# EAGLE design Fernsteuerung (EAGLE 7.7.0)
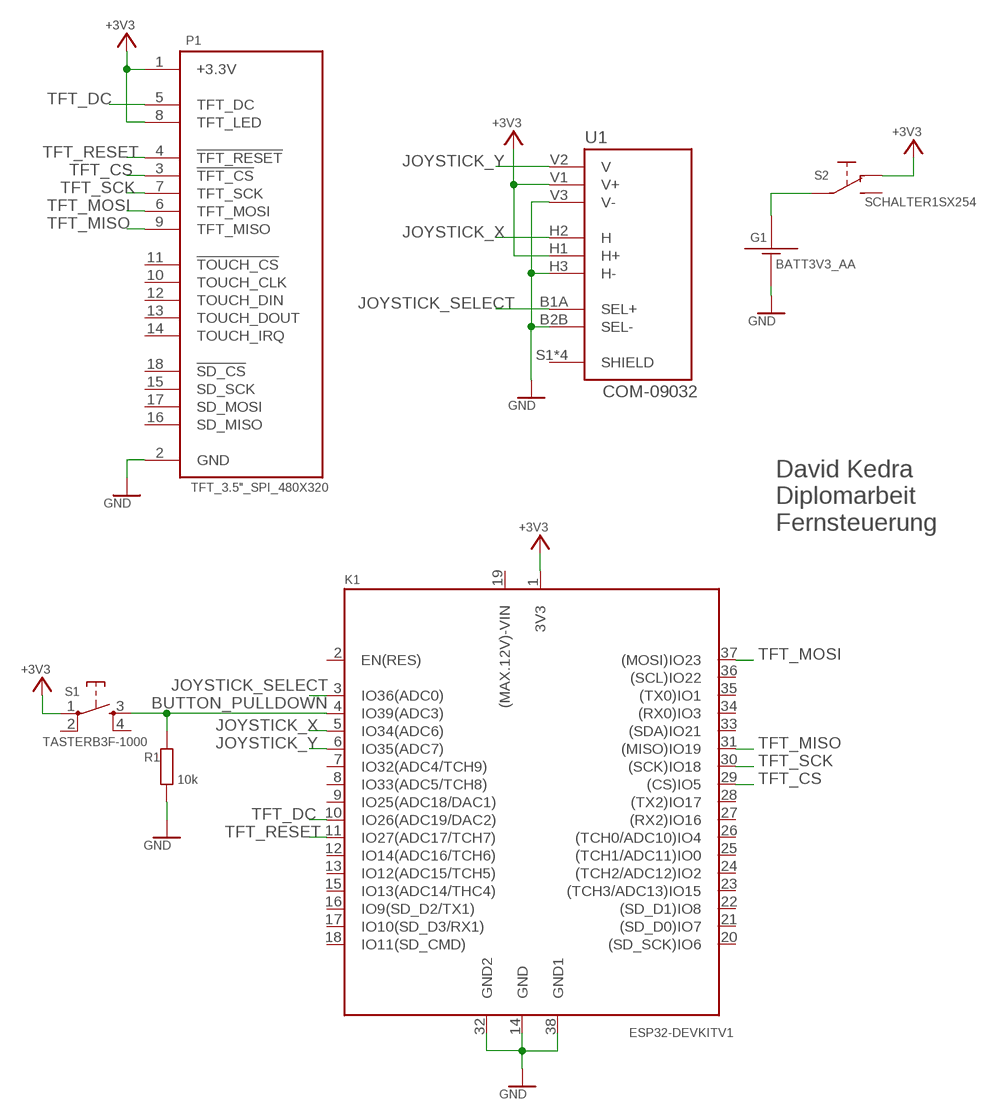
[diagram p0: schematic, sheet 1]

## Parts
G1  BATT3V3_AA  [BATT-3V3-AA]
K1  ESP32DEVKITV11000MIL  [ESP32-DEVKITV1]
P1  TFT_3.5"_SPI_480X320  [TFT_3.5"_SPI_480X320]
R1  10k  R1206  [R1206]
S1  TASTERB3F-1000  [B3F-10XX]
S2  SCHALTER1SX254  [SX254]
U1  COM-09032  [XDCR_COM-09032]

## Nets
+3V3: K1.1(3V3) P1.1(+3.3V) P1.8(TFT_LED) S1.1(P) S2.O1 U1.H1(H+) U1.V1(V+)
BATTERY_+3V3: G1.PLUS S2.W1
BUTTON_PULLDOWN: K1.4(IO39(ADC3)) R1.2 S1.3(S)
GND: G1.MINUS K1.14(GND) K1.32(GND2) K1.38(GND1) P1.2(GND) R1.1 U1.B2B(SEL-) U1.H3(H-) U1.V3(V-)
JOYSTICK_SELECT: K1.3(IO36(ADC0)) U1.B1A(SEL+)
JOYSTICK_X: K1.5(IO34(ADC6)) U1.H2(H)
JOYSTICK_Y: K1.6(IO35(ADC7)) U1.V2(V)
TFT_CS: K1.29((CS)IO5) P1.3(!TFT_CS!)
TFT_DC: K1.10(IO26(ADC19/DAC2)) P1.5(TFT_DC)
TFT_MISO: K1.31((MISO)IO19) P1.9(TFT_MISO)
TFT_MOSI: K1.37((MOSI)IO23) P1.6(TFT_MOSI)
TFT_RESET: K1.11(IO27(ADC17/TCH7)) P1.4(!TFT_RESET!)
TFT_SCK: K1.30((SCK)IO18) P1.7(TFT_SCK)
Unconnected: K1.2(EN(RES)) K1.7(IO32(ADC4/TCH9)) K1.8(IO33(ADC5/TCH8)) K1.9(IO25(ADC18/DAC1)) K1.12(IO14(ADC16/TCH6)) K1.13(IO12(ADC15/TCH5)) K1.15(IO13(ADC14/THC4)) K1.16(IO9(SD_D2/TX1)) K1.17(IO10(SD_D3/RX1)) K1.18(IO11(SD_CMD)) K1.19((MAX.12V)-VIN) K1.20((SD_SCK)IO6) K1.21((SD_D0)IO7) K1.22((SD_D1)IO8) K1.23((TCH3/ADC13)IO15) K1.24((TCH2/ADC12)IO2) K1.25((TCH1/ADC11)IO0) K1.26((TCH0/ADC10)IO4) K1.27((RX2)IO16) K1.28((TX2)IO17) K1.33((SDA)IO21) K1.34((RX0)IO3) K1.35((TX0)IO1) K1.36((SCL)IO22) P1.10(TOUCH_CLK) P1.11(!TOUCH_CS!) P1.12(TOUCH_DIN) P1.13(TOUCH_DOUT) P1.14(TOUCH_IRQ) P1.15(SD_SCK) P1.16(SD_MISO) P1.17(SD_MOSI) P1.18(!SD_CS!) S1.2(P1) S1.4(S1) S2.S1 U1.S1(SHIELD) U1.S2(SHIELD) U1.S3(SHIELD) U1.S4(SHIELD)

## Notes on the sheet
- David Kedra
  Diplomarbeit
  Fernsteuerung

## Library data of the parts
G1 = HTL22_basis:BATT: Batterieanschluss Folgende Batteriegrößen sind enthalten: 9V-Batterieclip Drahtanschluss 9V-Batterieclip Drahtanschluss Reverse 9V-Batteriehalter Keystone Datum: 26.03.2019 erstellt von: neca@htl-donaustadt.at
K1 = HTL22_Eagle7_Controller:ESP32DEVKITV1: ESP32, Diverse
P1 = TFT SPI 3.5inch 480x320 ILI9488:TFT_3.5"_SPI_480X320: TFT 3.5" SPI 480X320 NOT CONFIRMED DATASHEET: http://www.lcdwiki.com/3.5inch_SPI_Module_ILI9488_SKU:MSP3520
R1 = HTL22_basis:R: Widerstand Ohmsche Widerstände nach den gültigen Normen : IEC 60617 und EN 81346-2 Folgende Baugrößen sind enthalten: 204 Rastermaß 5mm 204 Rastermaß 7,5mm 204 Rastermaß 10mm 207 Rastermaß 10mm 207 Rastermaß 12mm 207 Rastermaß 15mm 309 Rastermaß 10mm 309 Rastermaß 15mm SMD: 0805 und 1206 Datum: 02.09.2018 erstellt von: neca@htl-donaustadt.at
S1 = HTL22_basis:TASTER: Drucktaster, verschiedene Typen B3F-10XX B3F-10XX SMD B3F-4000 PTS525 neca@htl-donaustadt.at
S2 = HTL22_basis:SCHALTER1: Schalter mit Wechslerfunktion enthält: C&K OS-Series 90° TeileNr.: OS103011 C&K OS-Series 0° Schiebeschalter, Hartmann Sunrom Typ 4273 SMD-Switch E-Switch LC1258 Type Erstellt: 13.02.19 von neca@htl-donaustadt.at
U1 = joystick COM-09032:COM-09032: Thumb Joystick Check availability <https://pricing.snapeda.com/parts/COM-09032/SparkFun%20Electronics/view-part?ref=eda>; AVAILABILITY: In Stock; CHECK_PRICES: https://www.snapeda.com/parts/COM-09032/SparkFun+Electronics/view-part/?ref=eda; DESCRIPTION: Joystick, 2 - Axis Analog (Resistive) Output; MF: SparkFun Electronics; MP: COM-09032; PACKAGE: Package; PRICE: None; SNAPEDA_LINK: https://www.snapeda.com/parts/COM-09032/SparkFun+Electronics/view-part/?ref=snap

## Board
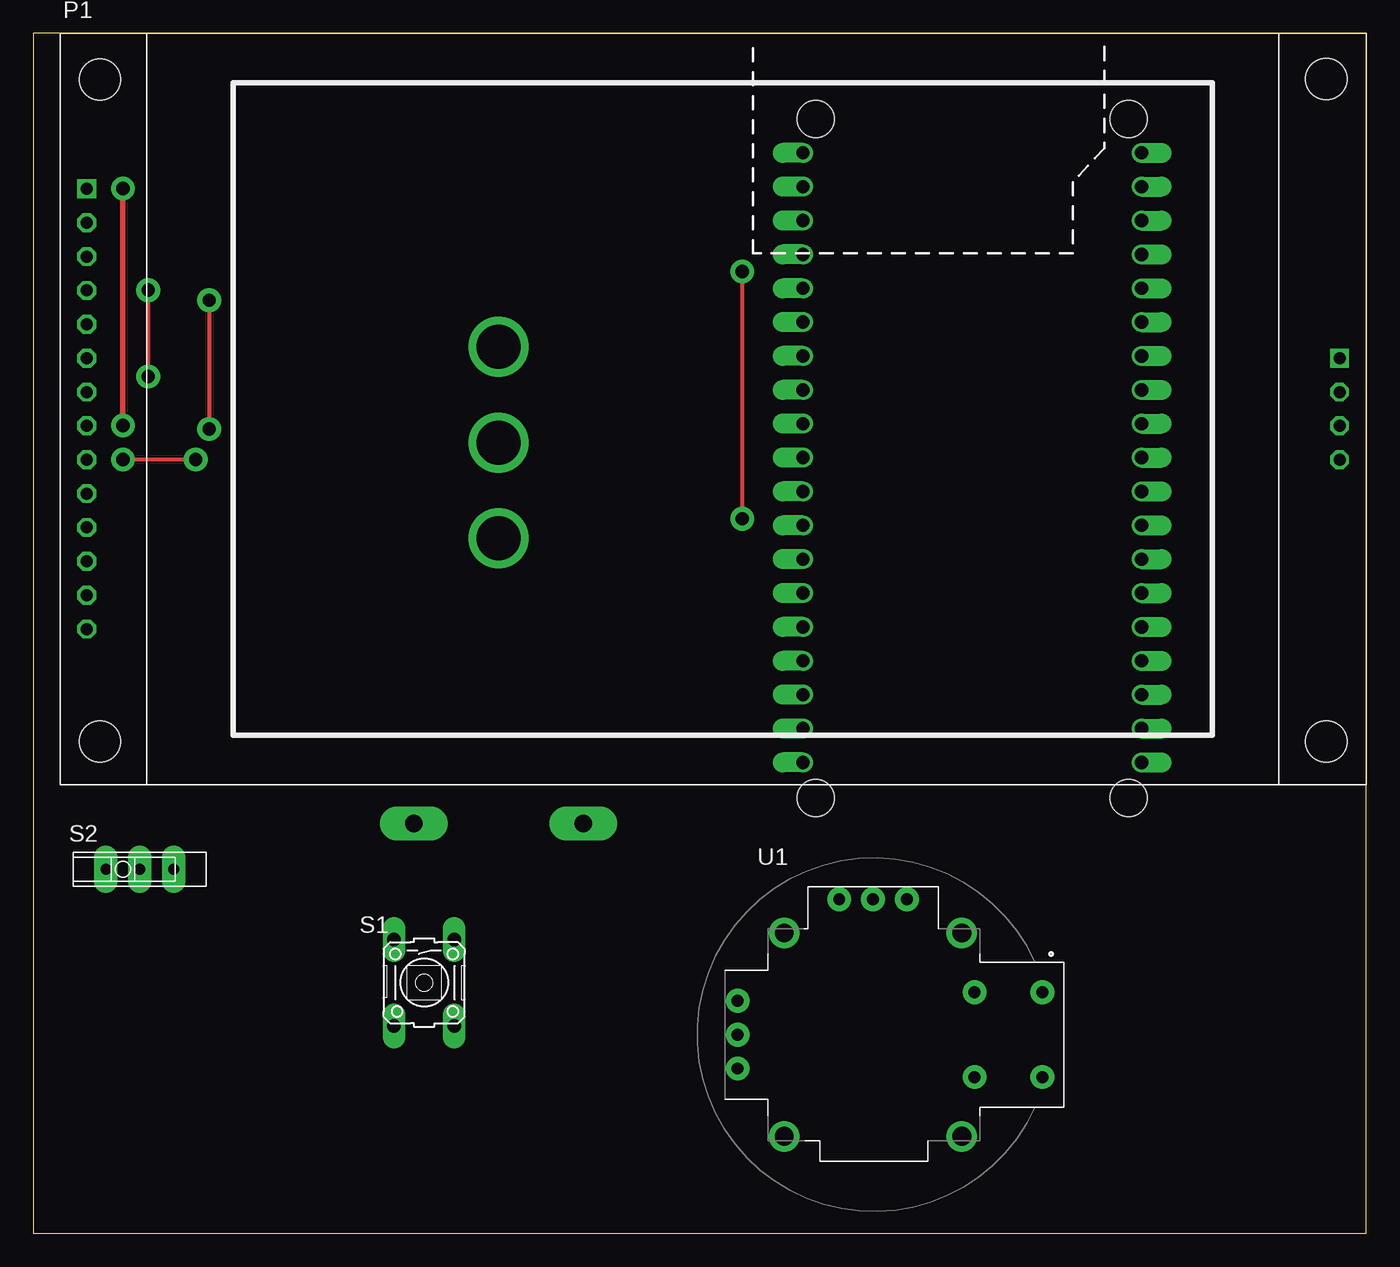
[diagram p1: board, top side]
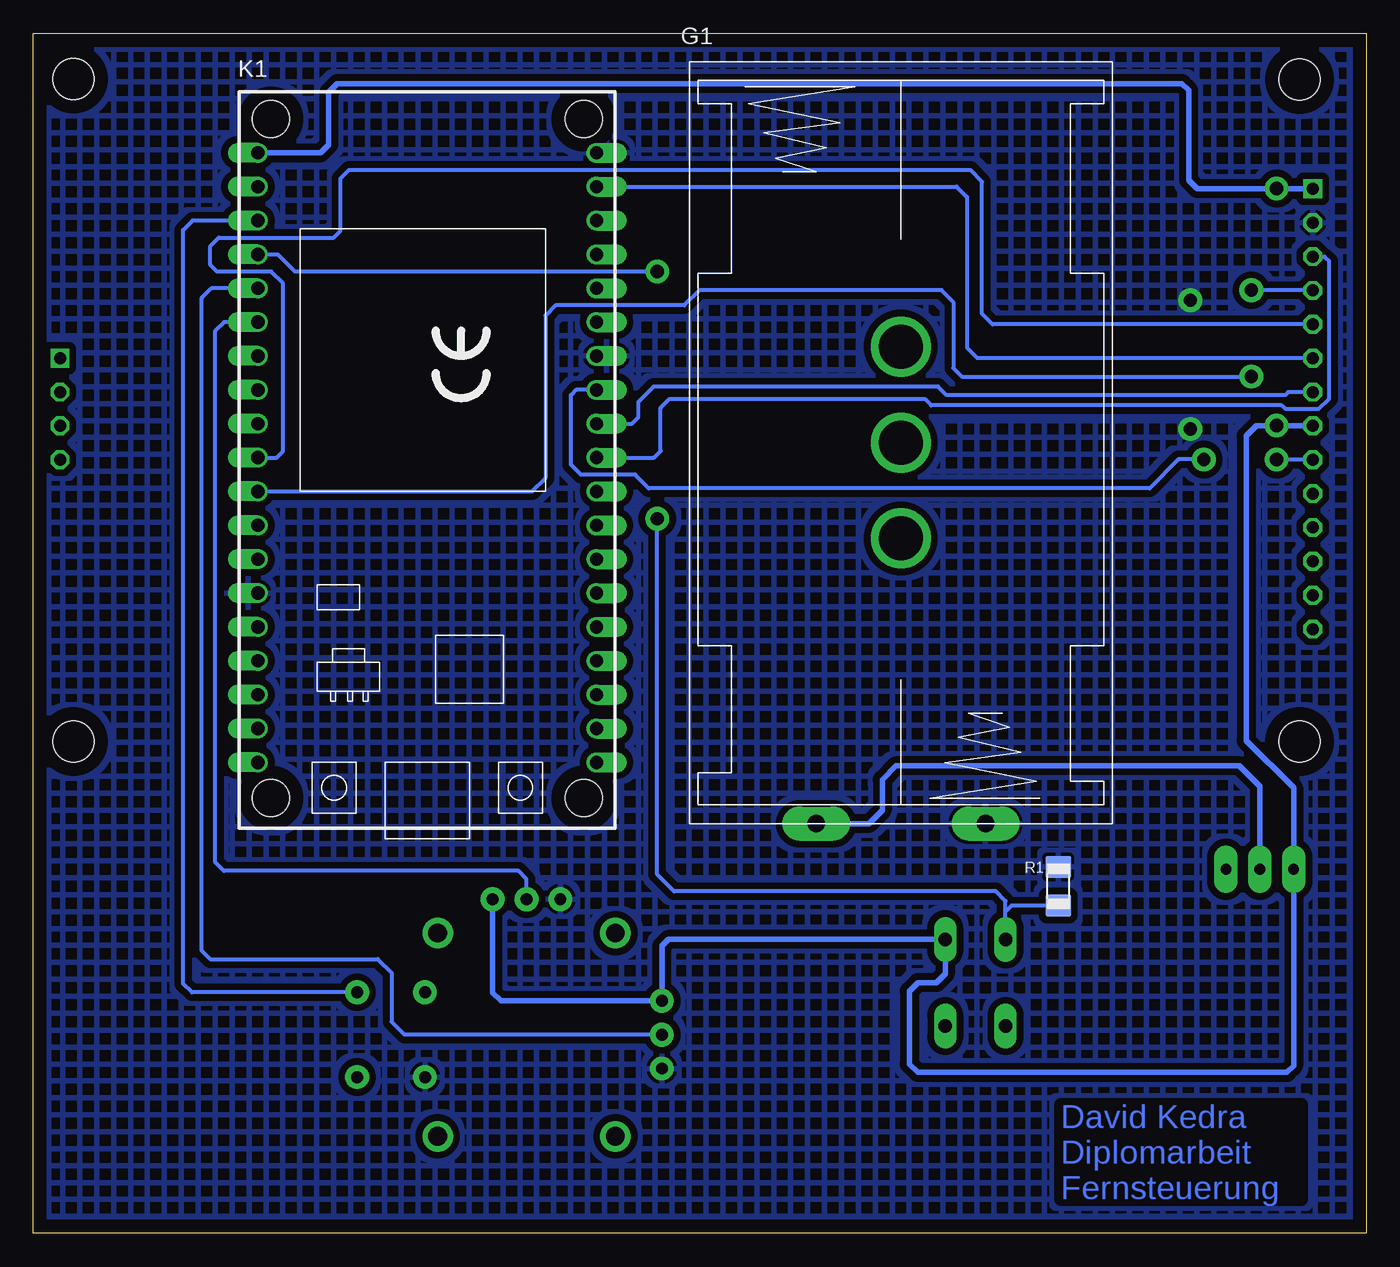
[diagram p2: board, bottom side, seen from below]

Size 100 x 90 mm. Coordinates in mm from the lower left corner, seen from the top.
Outline: 0,0 100,0 100,90 0,90 0,0
Copper layers (1*16): Top 0.035mm / dielectric 1.5mm / Bottom 0.035mm
Design rules "default *": minimum track width 12mil, minimum drill 24mil, track to track 12mil, track to pad 12mil, pad to pad 12mil, via to via 12mil, smd to smd 12mil, copper to edge 40mil, drill to drill 8mil, minimum pad ring 10mil, minimum via ring 8mil, stop-mask expansion 4mil, vias tented up to drill 0mil, thermal gap 10mil

### Footprints (pad centres in the part's own frame; a part is rotated, then mirrored left to right if it is on the bottom)
BATT-3V3-AA = drill 1.3 pad 2.54 long: MINUS 6.35,-28.575; PLUS -6.35,-28.575 | drill 3.3 pad 4.5: P$1 0,0; P$2 0,-7.188; P$3 0,7.188
ESP32-DEVKITV1 = drill 1 pad 1.422 offset: 1 0,0; 2 2.54,0; 3 5.08,0; 4 7.62,0; 5 10.16,0; 6 12.7,0; 7 15.24,0; 8 17.78,0; 9 20.32,0; 10 22.86,0; 11 25.4,0; 12 27.94,0; 13 30.48,0; 14 33.02,0; 15 35.56,0; 16 38.1,0; 17 40.64,0; 18 43.18,0; 19 45.72,0; 20 45.72,25.4; 21 43.18,25.4; 22 40.64,25.4; 23 38.1,25.4; 24 35.56,25.4; 25 33.02,25.4; 26 30.48,25.4; 27 27.94,25.4; 28 25.4,25.4; 29 22.86,25.4; 30 20.32,25.4; 31 17.78,25.4; 32 15.24,25.4; 33 12.7,25.4; 34 10.16,25.4; 35 7.62,25.4; 36 5.08,25.4; 37 2.54,25.4; 38 0,25.4 | hole 2.8: 48.387,0.965; 48.387,24.435; -2.54,24.435; -2.54,0.965
TFT_3.5"_SPI_480X320 = drill 0.9 square: 1 11.66,2; 18 24.36,96 | drill 0.9 octagon: 2 14.2,2; 3 16.74,2; 4 19.28,2; 5 21.82,2; 6 24.36,2; 7 26.9,2; 8 29.44,2; 9 31.98,2; 10 34.52,2; 11 37.06,2; 12 39.6,2; 13 42.14,2; 14 44.68,2; 15 31.98,96; 16 29.44,96; 17 26.9,96 | hole 3.1: 3.45,3; 3.42,95; 53.1,95; 53.1,3
R1206 = smd 1.651 x 1.905: 1 -1.448,0; 2 1.448,0
B3F-10XX = drill 1 pad 1.676 long: 1 -3.251,2.261; 2 3.251,2.261; 3 -3.251,-2.261; 4 3.251,-2.261
SX254 = drill 0.8 pad 1.778 long: O1 -2.54,0; S1 2.54,0; W1 0,0
XDCR_COM-09032 = drill 0.9 pad 1.778: B1A -3.175,12.7; B1B 3.175,12.7; B2A -3.175,7.62; B2B 3.175,7.62 | drill 0.889 pad 1.778: H1 -2.54,-10.16; H2 0,-10.16; H3 2.54,-10.16; V1 -10.16,2.54; V2 -10.16,0; V3 -10.16,-2.54 | drill 1.397 pad 2.286: S1 -7.62,6.668; S2 -7.62,-6.668; S3 7.62,-6.668; S4 7.62,6.668

### Placement (x,y rotation side)
DRILEGEND  [DRILEGEND]  -4.73,-7.96 0 top  (outside the outline)
G1  34.91,59.31 0 bottom
K1  83.14,81.04 270 bottom
P1  2,90 270 top
R1  23.1,26.04 270 bottom
S1  29.32,18.8 270 top
S2  7.99,27.3 0 top
U1  63,14.9 270 top
U$1  [ARROW-->]  105,90 90 top  (outside the outline)
U$2  [ARROW-->]  1,95 180 top  (outside the outline)
U$3  [ARROW<--]  100,95 180 top  (outside the outline)
U$4  [ARROW<--]  105,0 90 top  (outside the outline)

### Tracks (layer width: path | path; a pad name or v marks a point on that pad's centre or on a via)
+3V3  (via drill 1 pad 1.78)
  Top 0.406: v6.71,60.58 v6.71,78.36
  Bottom 0.305: S2.O1 5.45,27.05 | 6.7,78.34 v6.71,78.36
  Bottom 0.406: P1.8 6.71,60.56 v6.71,60.58 8.24,60.58 9,59.82 9,36.96 5.45,33.4 S2.O1 5.45,12.57 5.95,12.06 33.64,12.06 34.27,12.7 34.27,18.16 33.64,18.8 32.24,18.8 31.58,19.46 S1.1 52.36,22.05 52.84,21.57 U1.H1 64.92,17.44 65.54,18.06 U1.V1 | P1.1 6.7,78.34 | v6.71,78.36 12.68,78.36 13.32,78.99 13.32,85.72 13.83,86.23 77.2,86.23 77.83,85.6 77.83,81.66 78.46,81.04 K1.1
BATTERY_+3V3
  Bottom 0.406: S2.W1 7.99,33.53 9.51,35.05 35.29,35.05 36.31,34.04 36.31,31.75 37.32,30.73 G1.PLUS
BUTTON_PULLDOWN  (via drill 1 pad 1.78)
  Top 0.305: v53.2,53.59 v53.2,72.14
  Bottom 0.305: S1.3 27.06,24.13 | 27.06,24.13 27.06,24.92 27.8,25.65 51.93,25.65 53.2,26.92 v53.2,53.59 | v53.2,72.14 80.38,72.14 81.64,73.41 83.13,73.41 K1.4 | R1.2 26.6,24.59 27.06,24.13
GND  (via drill 1 pad 1.78)
  Top 0.305: v13.19,69.98 v13.19,60.33
  pour Bottom (isolate 0.508, hatched): 0,0 100,0 100,90 0,90
JOYSTICK_SELECT
  Bottom 0.305: U1.B1A 88.1,18.07 88.76,18.73 88.76,75.25 88.04,75.96 K1.3
JOYSTICK_X
  Bottom 0.305: K1.5 86.65,70.88 87.36,70.17 87.36,21.21 86.72,20.57 74.15,20.57 73.14,19.56 73.14,15.88 72.16,14.9 U1.H2
JOYSTICK_Y
  Bottom 0.305: K1.6 85.69,68.34 86.34,67.69 86.34,27.81 85.71,27.18 63.61,27.18 63,26.57 U1.V2
TFT_CS
  Bottom 0.305: K1.29 53.44,58.18 52.94,58.67 52.94,61.91 52.31,62.55 33.07,62.55 32.62,62.1 6.33,62.1 6.08,61.85 3.54,61.85 2.78,62.61 2.78,72.9 3.14,73.26 P1.3
TFT_DC
  Bottom 0.305: P1.5 28.03,68.18 28.81,68.96 28.81,78.87 29.7,79.76 76.31,79.76 76.95,79.12 76.95,75.18 77.45,74.68 86.09,74.68 86.72,74.04 86.72,72.64 86.22,72.14 82.15,72.14 81.26,71.25 81.26,58.67 81.76,58.18 K1.10
TFT_MISO  (via drill 1 pad 1.78)
  Top 0.305: v6.71,58.04 v12.18,58.04
  Bottom 0.305: P1.9 6.7,58.02 v6.71,58.04 | K1.31 59.28,63.26 59.67,62.87 59.67,57.66 58.91,56.9 54.85,56.9 53.83,55.88 16.24,55.88 14.08,58.04 v12.18,58.04
TFT_MOSI
  Bottom 0.305: P1.6 29.18,65.64 29.96,66.42 29.96,77.72 30.73,78.5 K1.37
TFT_RESET  (via drill 1 pad 1.78)
  Top 0.305: v8.62,64.26 v8.62,70.74
  Bottom 0.305: K1.11 62.58,55.64 61.58,56.64 61.58,68.83 60.82,69.6 51.16,69.6 50.02,70.74 31.86,70.74 30.97,69.85 30.97,64.9 30.34,64.26 v8.62,64.26 | P1.4 8.6,70.72 v8.62,70.74
TFT_SCK
  Bottom 0.305: K1.30 55.09,60.72 54.59,61.21 54.59,62.36 53.45,63.5 32.12,63.5 31.48,62.87 6.08,62.87 5.84,63.1 P1.7

### Text on the board
Bottom: David Kedra / Diplomarbeit / Fernsteuerung
Measures: 100mm | 90mm
tDocu: TOP | David Kedra / Diplomarbeit / Fernsteuerung
bDocu: BOTTOM | David Kedra / Diplomarbeit / Fernsteuerung
DrillLegend: LAYER-STACK
DrillLegend_01-16: 01-16
DrillLegend_01-20: 01-20